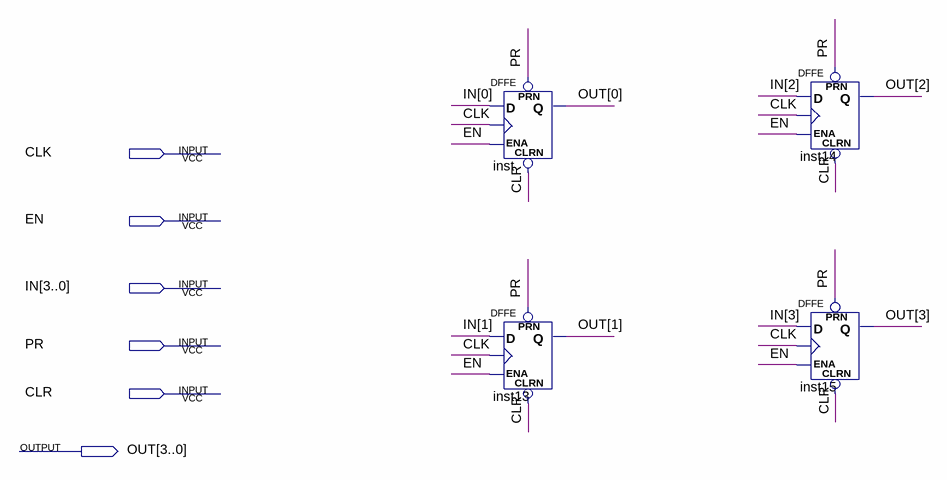
[diagram p0: schematic sheet]
// Quartus schematic 4Bit.bdf as structural Verilog: 4 symbols, 6 pins
module \4Bit  (
  input  CLK,
  input  EN,
  input  [3:0] IN,
  input  PR,
  input  CLR,
  output [3:0] OUT
);

  DFFE inst (.PRN(PR), .CLRN(CLR), .D(IN[0]), .CLK(CLK), .ENA(EN), .Q(OUT[0]));
  DFFE inst13 (.PRN(PR), .CLRN(CLR), .D(IN[1]), .CLK(CLK), .ENA(EN), .Q(OUT[1]));
  DFFE inst14 (.PRN(PR), .CLRN(CLR), .D(IN[2]), .CLK(CLK), .ENA(EN), .Q(OUT[2]));
  DFFE inst15 (.PRN(PR), .CLRN(CLR), .D(IN[3]), .CLK(CLK), .ENA(EN), .Q(OUT[3]));
endmodule
